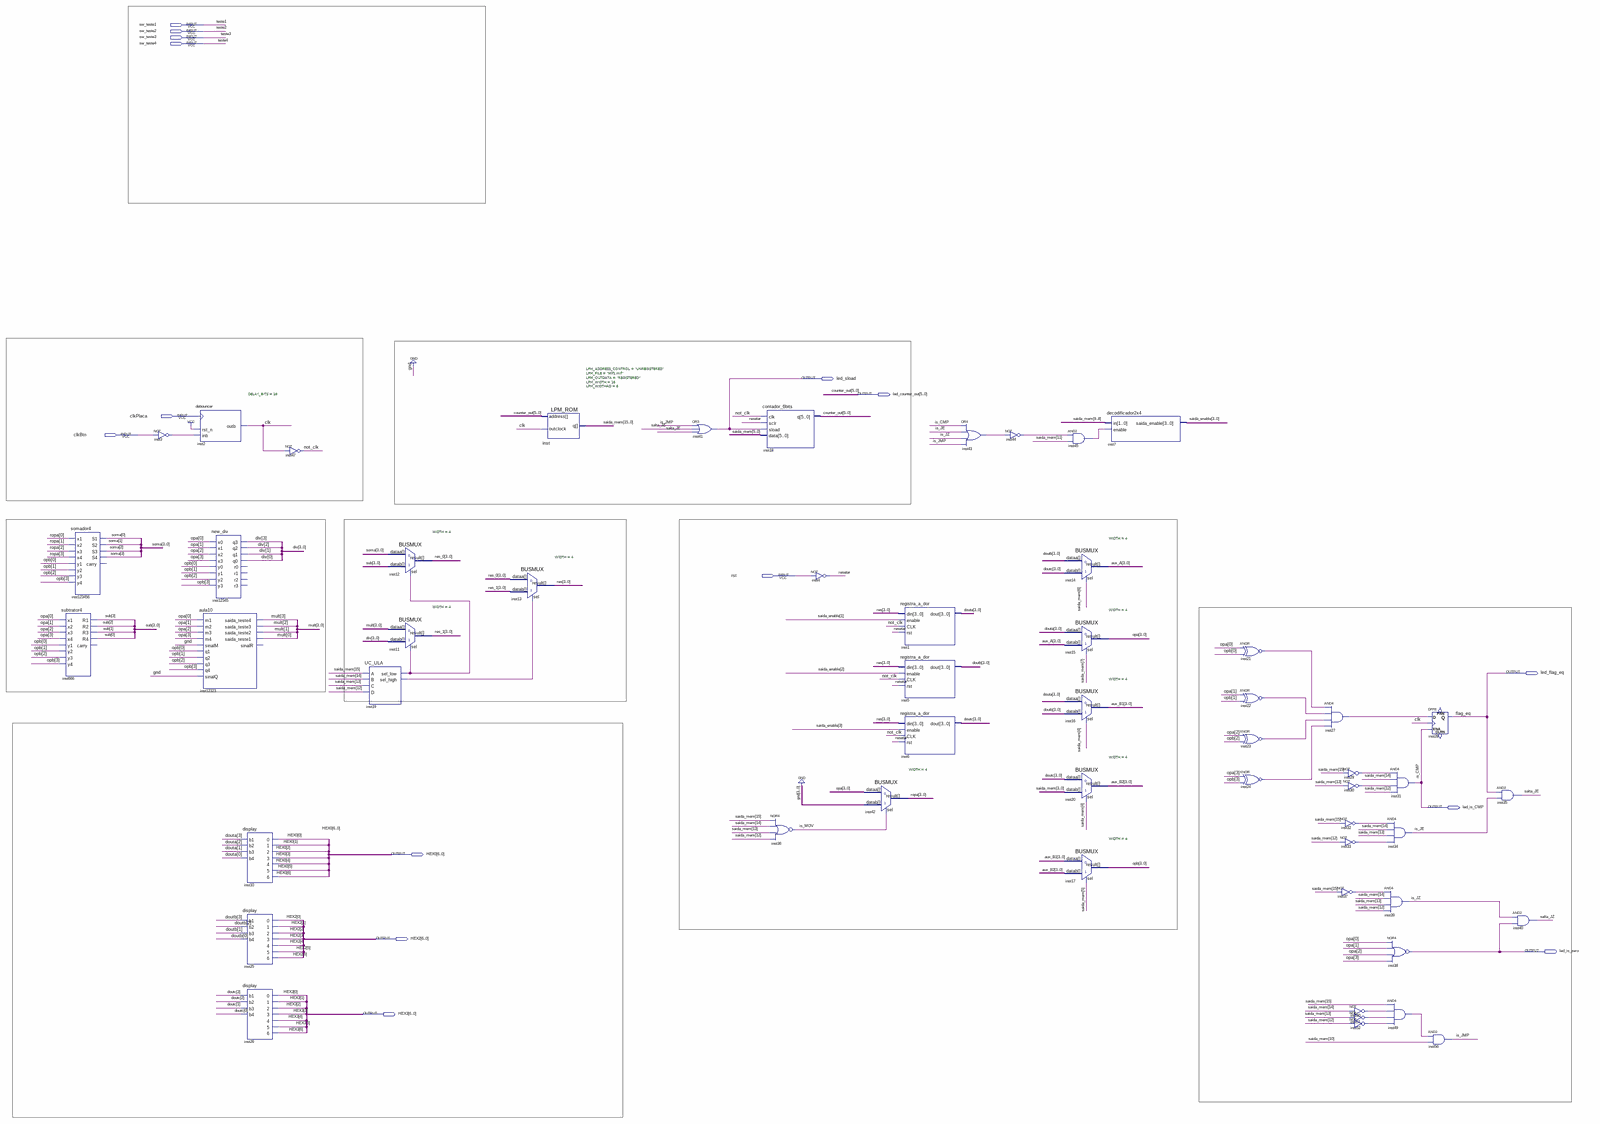
[diagram p0: schematic sheet, whole]
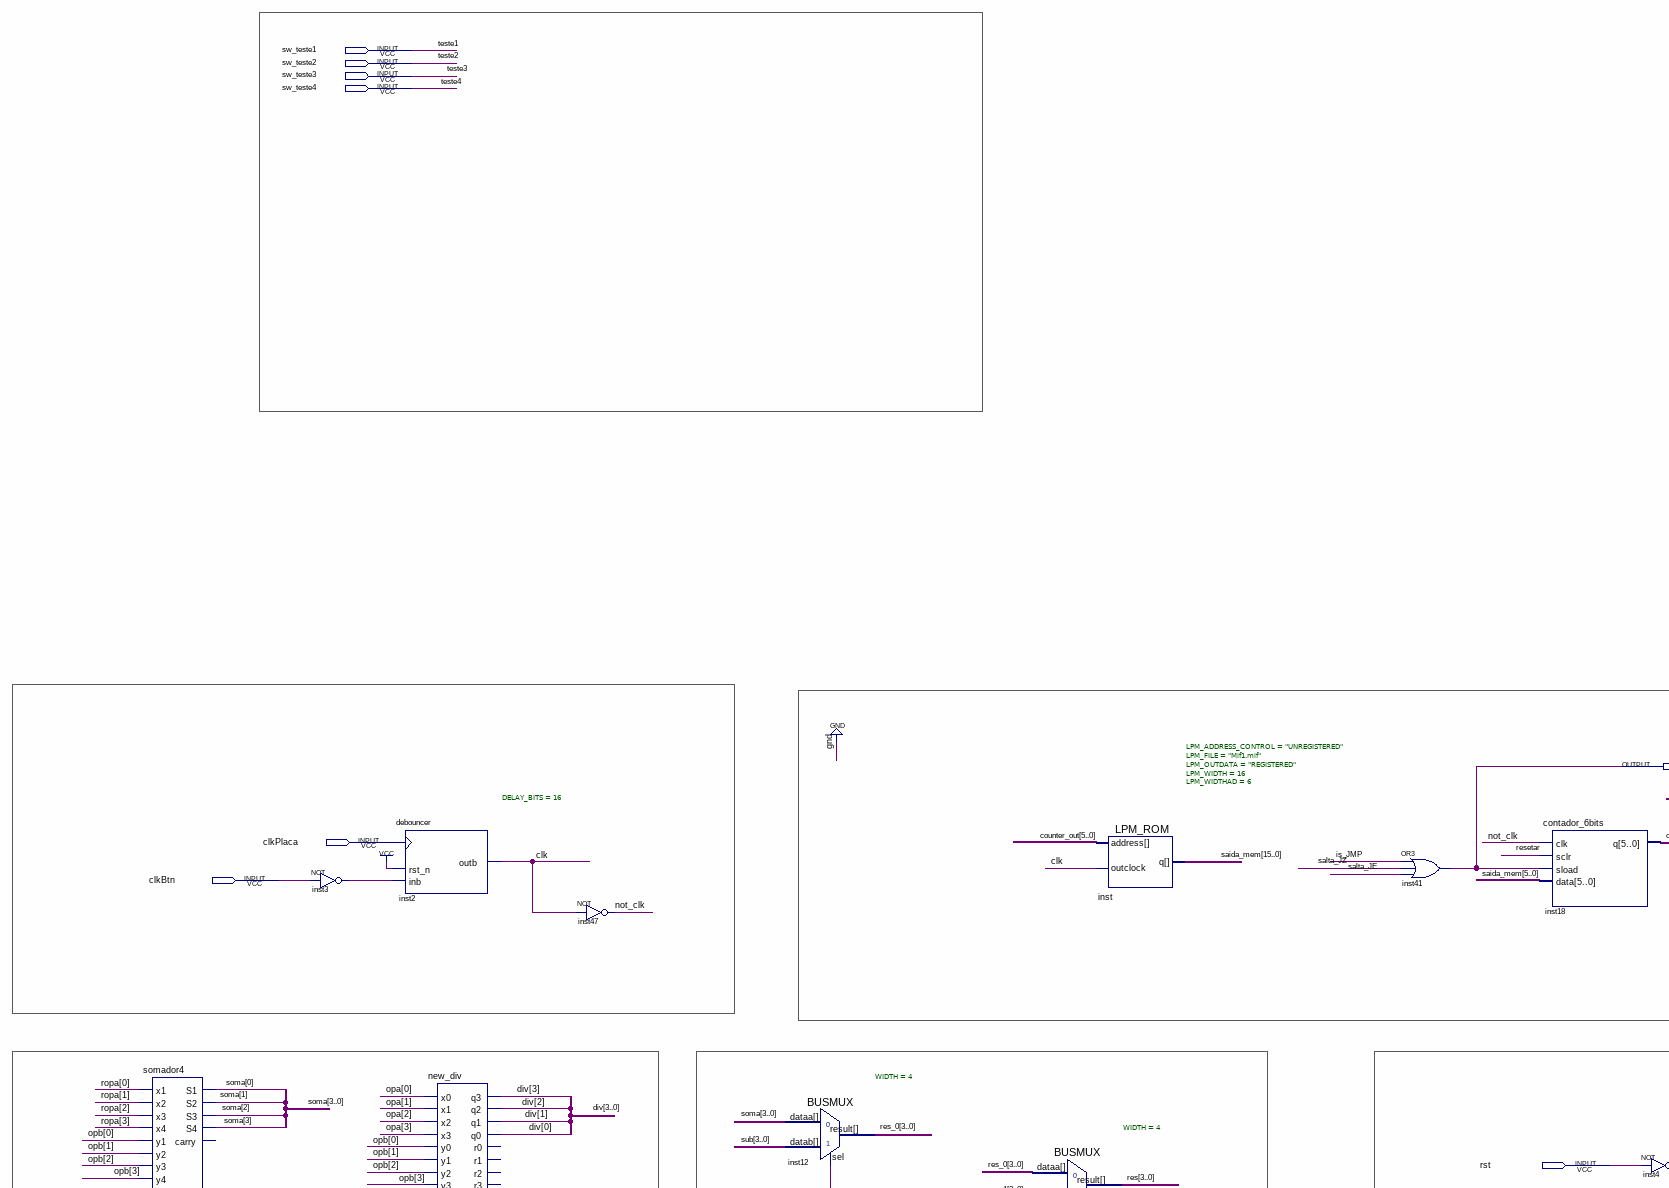
[diagram p1: schematic sheet, upper left part]
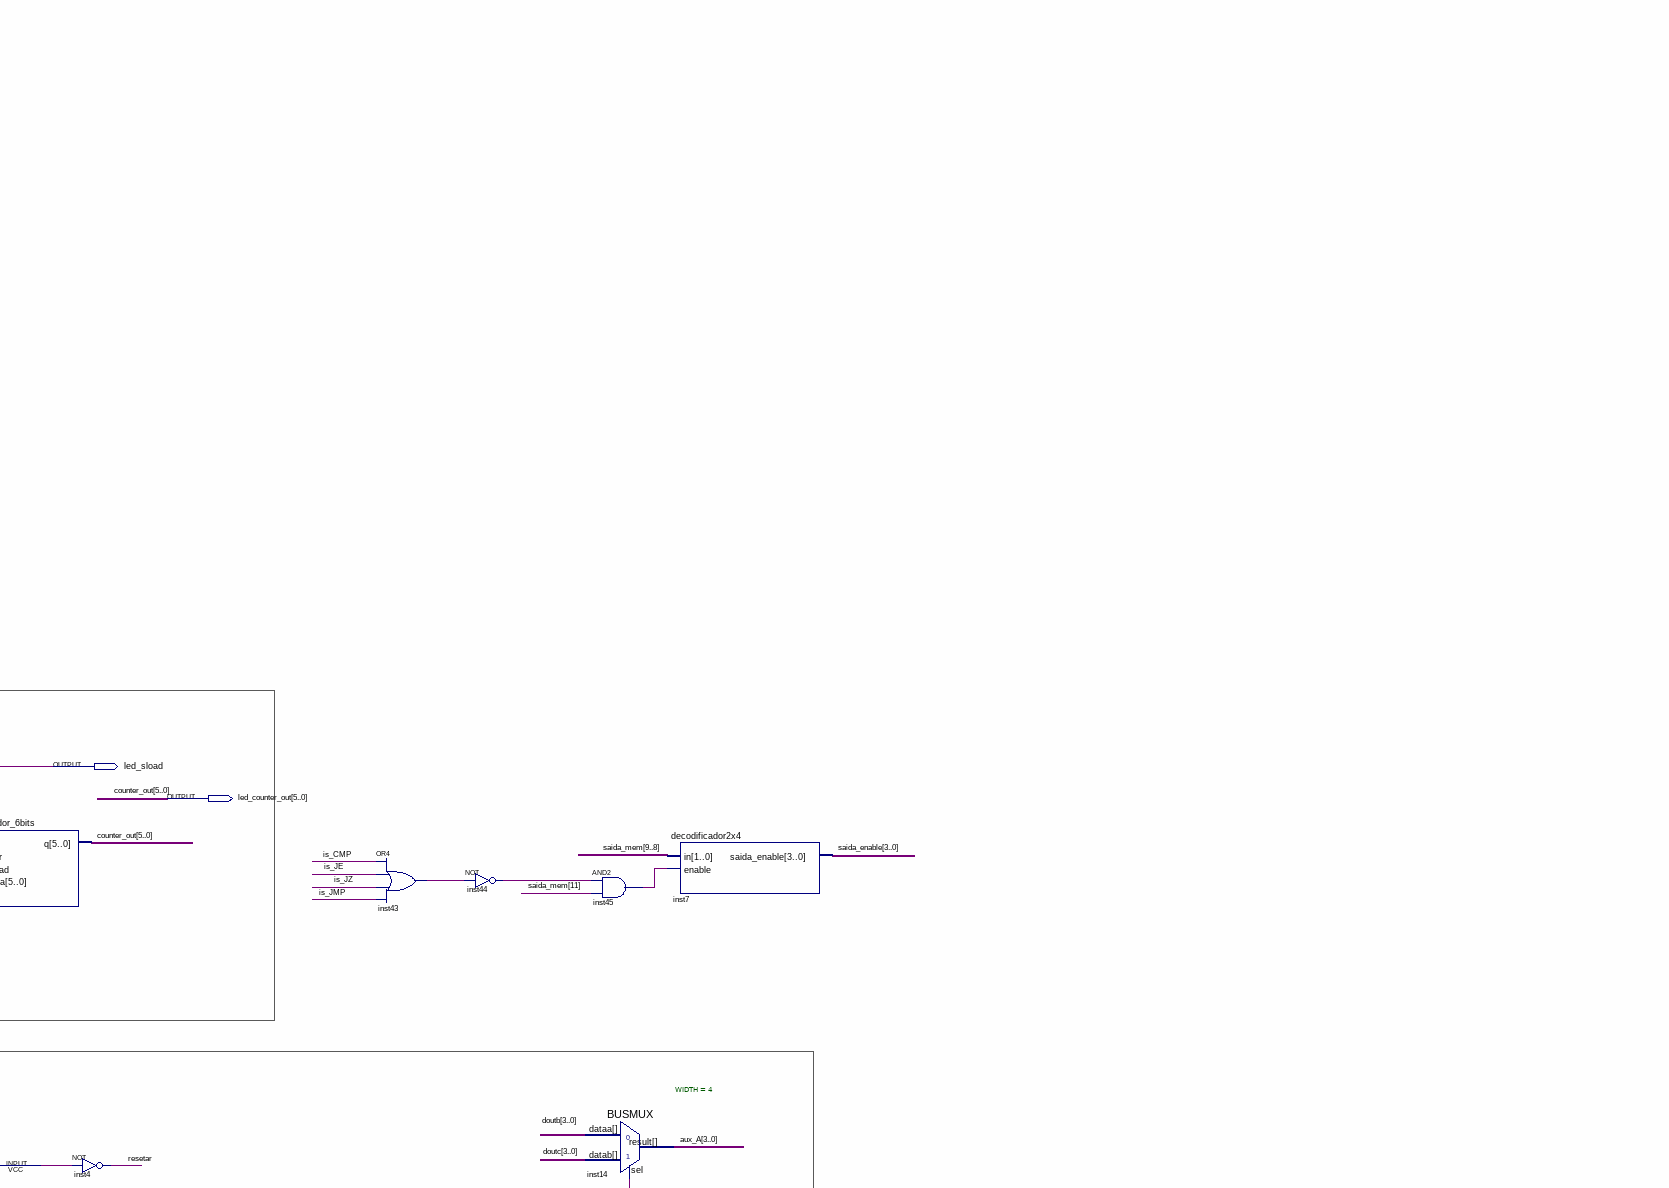
[diagram p2: schematic sheet, upper right part]
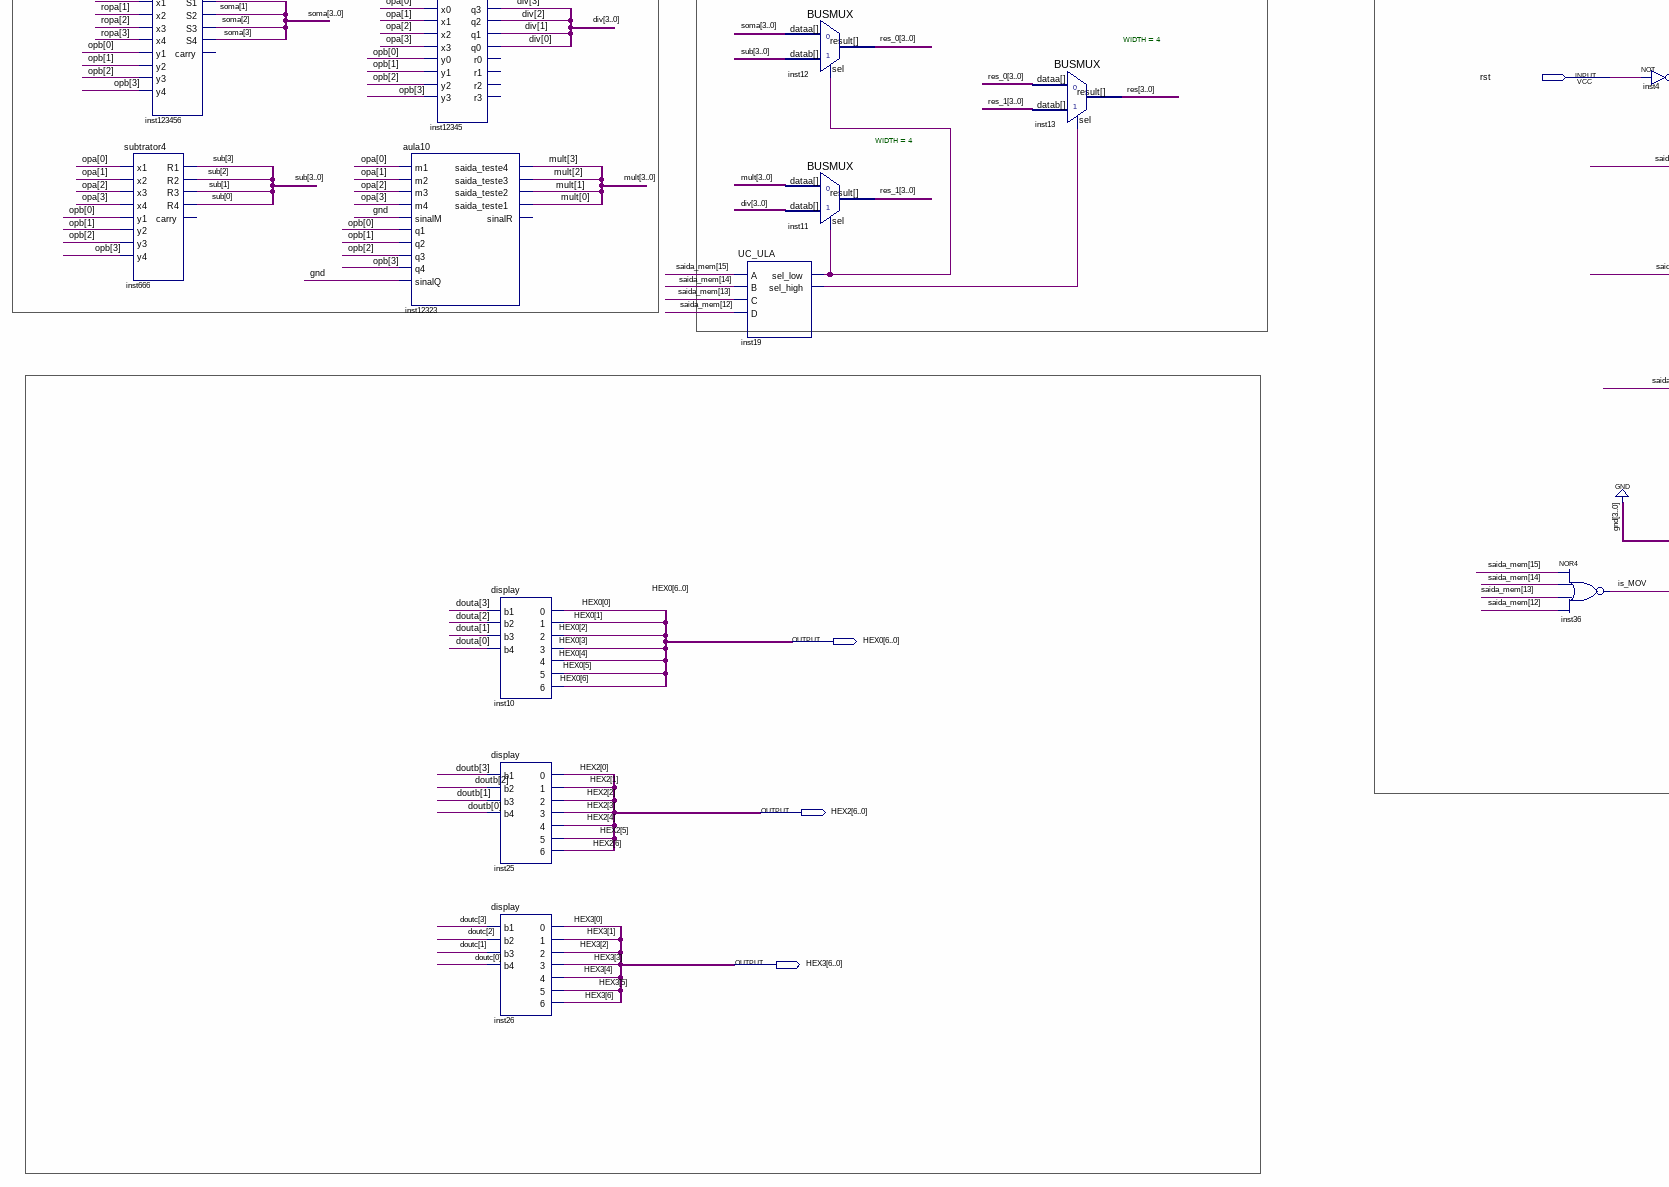
[diagram p3: schematic sheet, lower left part]
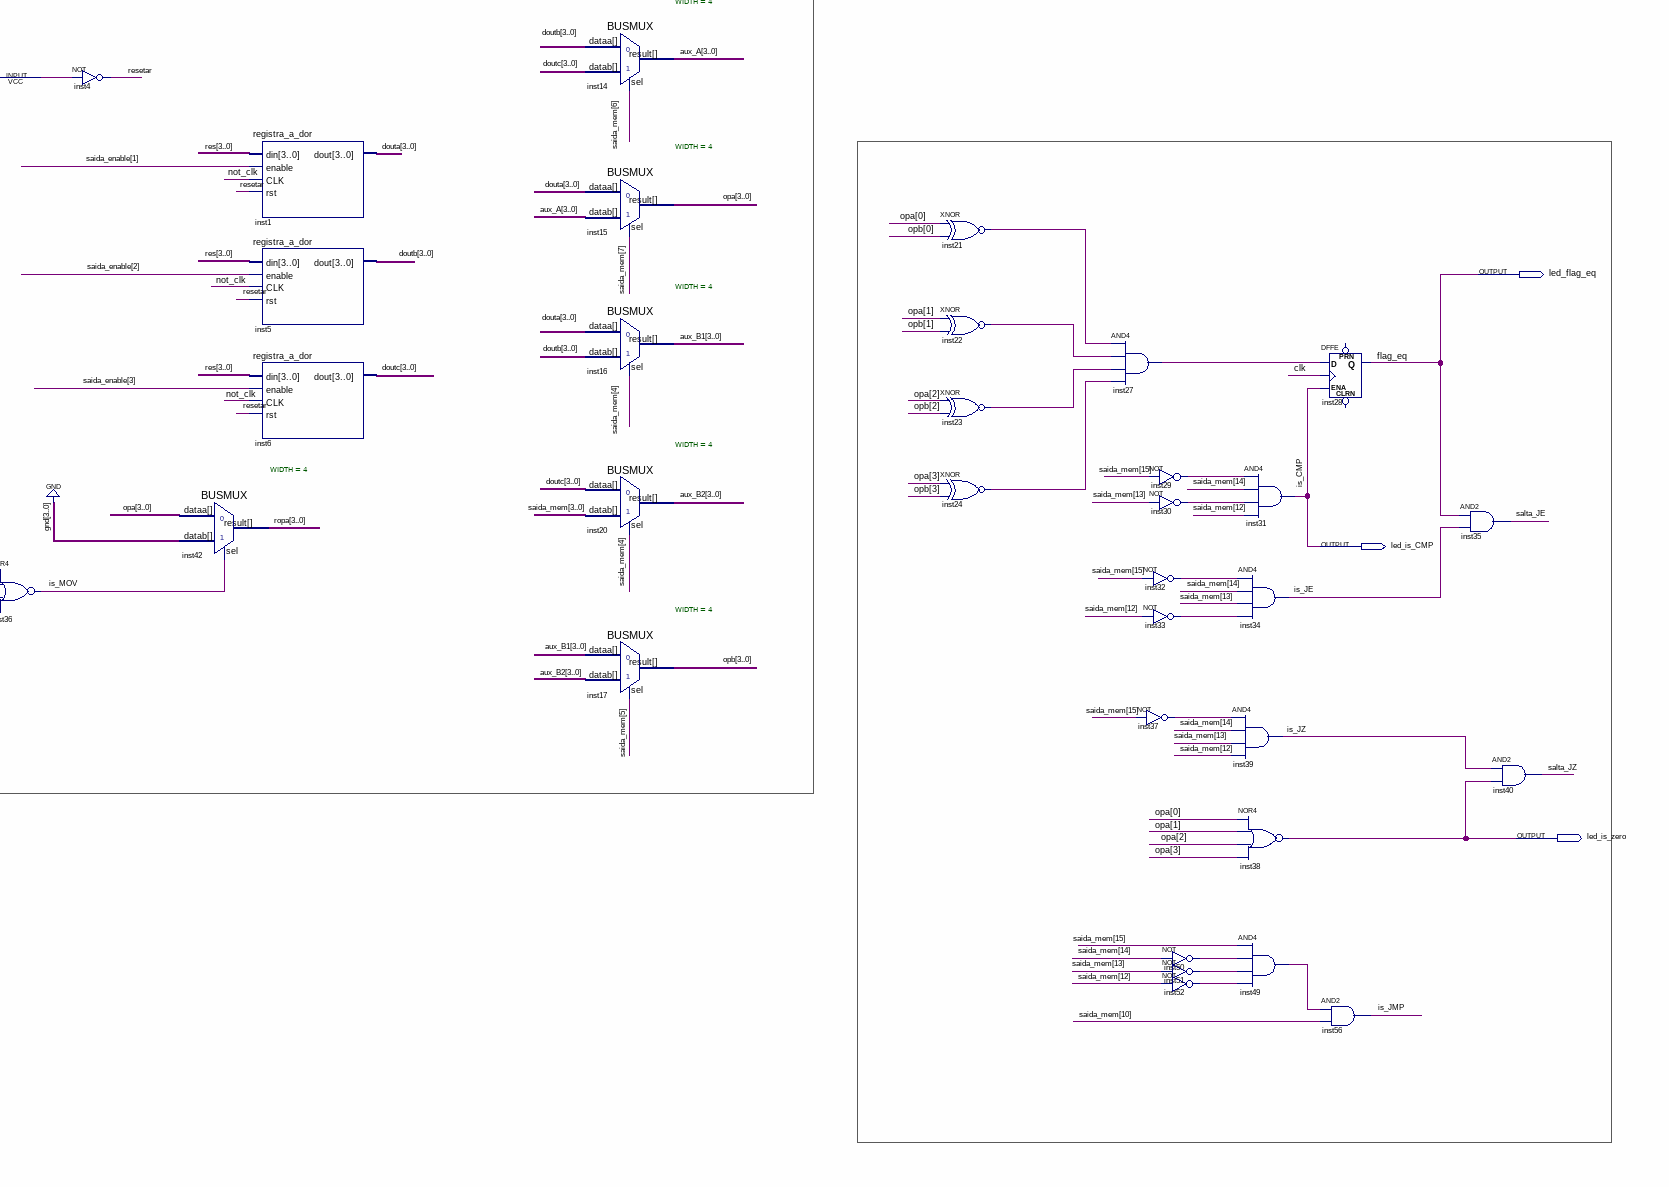
[diagram p4: schematic sheet, lower right part]
// Quartus schematic microCPU.bdf as structural Verilog: 54 symbols, 15 pins
module microCPU (
  input  sw_teste1,
  input  sw_teste2,
  input  sw_teste3,
  input  sw_teste4,
  input  clkPlaca,
  input  clkBtn,
  input  rst,
  output led_sload,
  output [5:0] led_counter_out,
  output led_flag_eq,
  output led_is_CMP,
  output [6:0] HEX0,
  output [6:0] HEX2,
  output led_is_zero,
  output [6:0] HEX3
);

  wire clk, inst3_out, inst19_sel_high, inst19_sel_low, inst21_out, inst22_out, inst23_out, inst24_out,
       inst27_out, inst29_out, inst30_out, inst32_out, inst33_out, inst37_out, inst43_out, inst44_out,
       inst45_out, inst49_out, inst50_out, inst51_out, inst52_out, is_JE, is_JMP, is_JZ, is_MOV, not_clk,
       resetar, salta_JE, salta_JZ;
  wire [3:0] aux_A, aux_B1, aux_B2, div, douta, doutb, doutc, mult, opa, opb, res, res_0, res_1, ropa,
       saida_enable, soma, sub;
  wire [15:0] saida_mem;

  somador4 inst123456 (
    .x1(ropa[0]), .x2(ropa[1]), .x3(ropa[2]), .x4(ropa[3]), .y1(opb[0]), .y2(opb[1]), .y3(opb[2]),
    .y4(opb[3]), .S1(soma[0]), .S2(soma[1]), .S3(soma[2]), .S4(soma[3]));  // open: carry
  subtrator4 inst666 (
    .x1(opa[0]), .x2(opa[1]), .x3(opa[2]), .x4(opa[3]), .y1(opb[0]), .y2(opb[1]), .y3(opb[2]), .y4(opb[3]),
    .R1(sub[3]), .R2(sub[2]), .R3(sub[1]), .R4(sub[0]));  // open: carry
  not inst3 (inst3_out, clkBtn);
  debouncer #(.DELAY_BITS(16)) inst2 (.rst_n(1'b1), .inb(inst3_out), .clk(clkPlaca), .outb(clk));
  aula10 inst12323 (
    .m1(opa[0]), .m2(opa[1]), .m3(opa[2]), .m4(opa[3]), .sinalM(1'b0), .q1(opb[0]), .q2(opb[1]), .q3(opb[2]),
    .q4(opb[3]), .sinalQ(1'b0), .saida_teste4(mult[3]), .saida_teste3(mult[2]), .saida_teste2(mult[1]),
    .saida_teste1(mult[0]));  // open: sinalR
  new_div inst12345 (
    .x0(opa[0]), .x1(opa[1]), .x2(opa[2]), .x3(opa[3]), .y0(opb[0]), .y1(opb[1]), .y2(opb[2]), .y3(opb[3]),
    .q0(div[0]), .q1(div[1]), .q2(div[2]), .q3(div[3]));  // open: r0, r1, r2, r3
  display inst10 (
    .b1(douta[3]), .b2(douta[2]), .b3(douta[1]), .b4(douta[0]), .\0 (HEX0[0]), .\1 (HEX0[1]), .\2 (HEX0[2]),
    .\3 (HEX0[3]), .\4 (HEX0[4]), .\5 (HEX0[5]), .\6 (HEX0[6]));
  display inst25 (
    .b1(doutb[3]), .b2(doutb[2]), .b3(doutb[1]), .b4(doutb[0]), .\0 (HEX2[0]), .\1 (HEX2[1]), .\2 (HEX2[2]),
    .\3 (HEX2[3]), .\4 (HEX2[4]), .\5 (HEX2[5]), .\6 (HEX2[6]));
  display inst26 (
    .b1(doutc[3]), .b2(doutc[2]), .b3(doutc[1]), .b4(doutc[0]), .\0 (HEX3[0]), .\1 (HEX3[1]), .\2 (HEX3[2]),
    .\3 (HEX3[3]), .\4 (HEX3[4]), .\5 (HEX3[5]), .\6 (HEX3[6]));
  not inst47 (not_clk, clk);
  UC_ULA inst19 (
    .A(saida_mem[15]), .B(saida_mem[14]), .C(saida_mem[13]), .D(saida_mem[12]), .sel_low(inst19_sel_low),
    .sel_high(inst19_sel_high));
  BUSMUX #(.WIDTH(4)) inst12 (.datab(sub), .sel(inst19_sel_low), .dataa(soma), .result(res_0));
  BUSMUX #(.WIDTH(4)) inst11 (.datab(div), .sel(inst19_sel_low), .dataa(mult), .result(res_1));
  BUSMUX #(.WIDTH(4)) inst13 (.datab(res_1), .sel(inst19_sel_high), .dataa(res_0), .result(res));
  LPM_ROM #(.LPM_ADDRESS_CONTROL("UNREGISTERED"), .LPM_FILE("Mif1.mif"), .LPM_OUTDATA("REGISTERED"), .LPM_WIDTH(16), .LPM_WIDTHAD(6)) inst (
    .address(led_counter_out), .outclock(clk), .q(saida_mem));
  or inst41 (led_sload, is_JMP, salta_JZ, salta_JE);
  contador_6bits inst18 (.clk(not_clk), .sclr(resetar), .sload(led_sload), .data(saida_mem[5:0]), .q(led_counter_out));
  nor inst36 (is_MOV, saida_mem[15], saida_mem[14], saida_mem[13], saida_mem[12]);
  not inst4 (resetar, rst);
  BUSMUX #(.WIDTH(4)) inst42 (.datab(4'b0000), .sel(is_MOV), .dataa(opa), .result(ropa));
  registra_a_dor inst1 (.din(res), .enable(saida_enable[1]), .CLK(not_clk), .rst(resetar), .dout(douta));
  registra_a_dor inst5 (.din(res), .enable(saida_enable[2]), .CLK(not_clk), .rst(resetar), .dout(doutb));
  registra_a_dor inst6 (.din(res), .enable(saida_enable[3]), .CLK(not_clk), .rst(resetar), .dout(doutc));
  or inst43 (inst43_out, led_is_CMP, is_JE, is_JZ, is_JMP);
  not inst44 (inst44_out, inst43_out);
  and inst45 (inst45_out, inst44_out, saida_mem[11]);
  BUSMUX #(.WIDTH(4)) inst14 (.datab(doutc), .sel(saida_mem[6]), .dataa(doutb), .result(aux_A));
  BUSMUX #(.WIDTH(4)) inst15 (.datab(aux_A), .sel(saida_mem[7]), .dataa(douta), .result(opa));
  BUSMUX #(.WIDTH(4)) inst16 (.datab(doutb), .sel(saida_mem[4]), .dataa(douta), .result(aux_B1));
  BUSMUX #(.WIDTH(4)) inst20 (.datab(saida_mem[3:0]), .sel(saida_mem[4]), .dataa(doutc), .result(aux_B2));
  BUSMUX #(.WIDTH(4)) inst17 (.datab(aux_B2), .sel(saida_mem[5]), .dataa(aux_B1), .result(opb));
  decodificador2x4 inst7 (.in(saida_mem[9:8]), .enable(inst45_out), .saida_enable(saida_enable));
  xnor inst21 (inst21_out, opa[0], opb[0]);
  xnor inst22 (inst22_out, opa[1], opb[1]);
  xnor inst23 (inst23_out, opa[2], opb[2]);
  xnor inst24 (inst24_out, opa[3], opb[3]);
  and inst27 (inst27_out, inst21_out, inst22_out, inst23_out, inst24_out);
  not inst29 (inst29_out, saida_mem[15]);
  not inst30 (inst30_out, saida_mem[13]);
  not inst32 (inst32_out, saida_mem[15]);
  not inst33 (inst33_out, saida_mem[12]);
  not inst37 (inst37_out, saida_mem[15]);
  not inst50 (inst50_out, saida_mem[14]);
  not inst51 (inst51_out, saida_mem[13]);
  not inst52 (inst52_out, saida_mem[12]);
  and inst39 (is_JZ, inst37_out, saida_mem[14], saida_mem[13], saida_mem[12]);
  and inst31 (led_is_CMP, inst29_out, saida_mem[14], inst30_out, saida_mem[12]);
  and inst34 (is_JE, inst32_out, saida_mem[14], saida_mem[13], inst33_out);
  nor inst38 (led_is_zero, opa[0], opa[1], opa[2], opa[3]);
  and inst49 (inst49_out, saida_mem[15], inst50_out, inst51_out, inst52_out);
  DFFE inst28 (.D(inst27_out), .CLK(clk), .ENA(led_is_CMP), .Q(led_flag_eq));  // open: PRN, CLRN
  and inst56 (is_JMP, inst49_out, saida_mem[10]);
  and inst35 (salta_JE, led_flag_eq, is_JE);
  and inst40 (salta_JZ, is_JZ, led_is_zero);

  // Other names for the same wires on the sheet: counter_out[5:0] = led_counter_out; flag_eq = led_flag_eq;
  //   is_CMP = led_is_CMP; teste1 = sw_teste1; teste2 = sw_teste2; teste3 = sw_teste3; teste4 = sw_teste4
endmodule
